# Altium schematic sheet TX_Node.SchDoc
size A; SheetNumber: 1; SheetTotal: 1
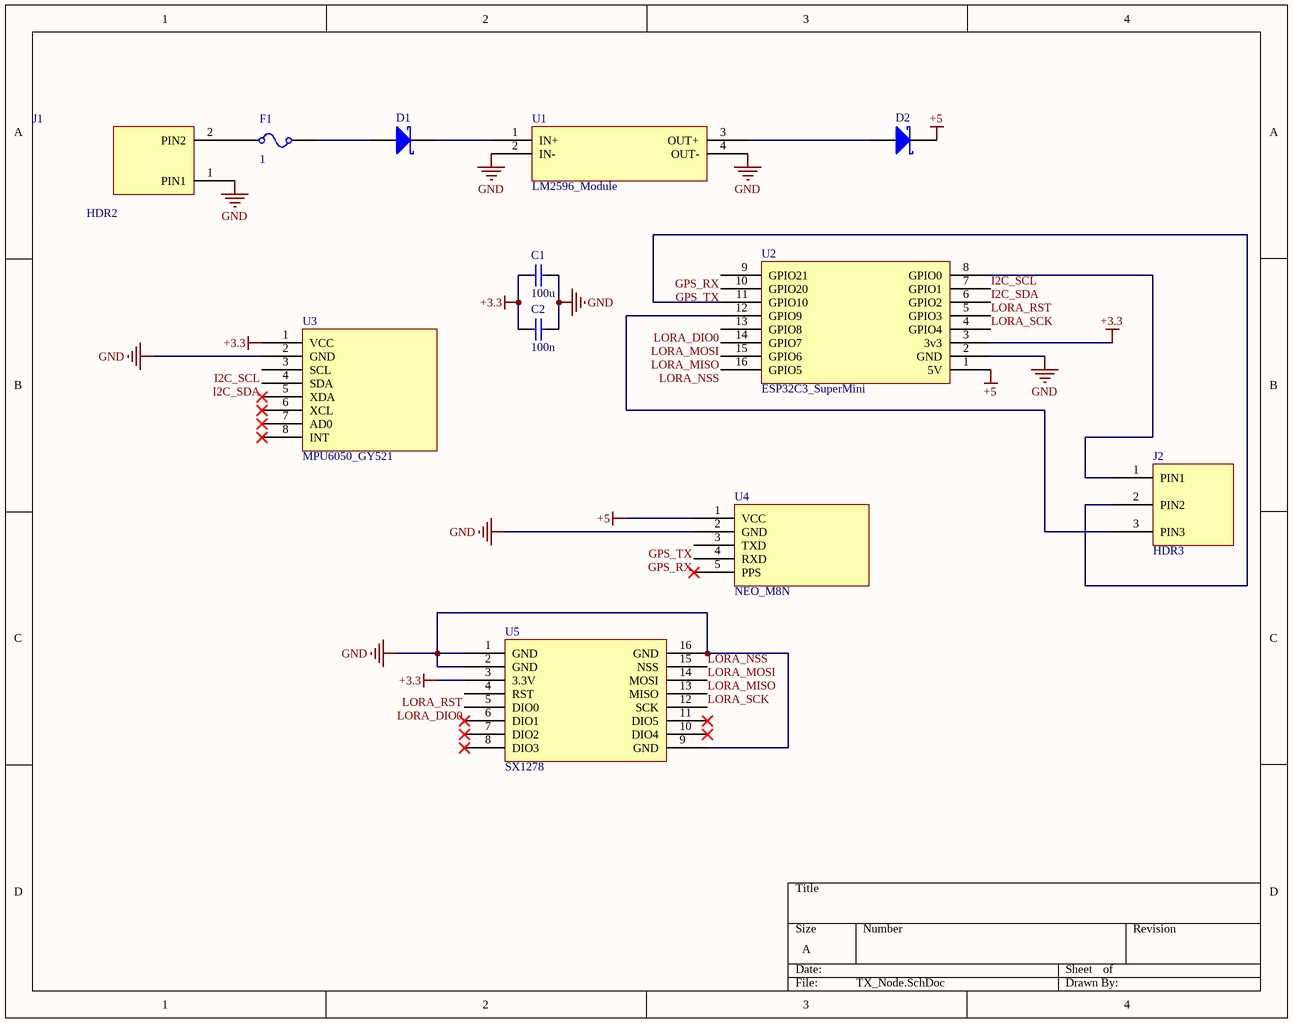
[diagram p0: TX_Node.SchDoc]

## Parts
C1  value 100u  [HDR_1X2]  (hidden comment: Capacitor)
C2  value 100n  [HDR_1X2]  (hidden comment: Capacitor)
D1  Schottky Diode  [TH_10MM]  (value not drawn)
D2  Schottky Diode  [TH_10MM]  (value not drawn)
F1  CURRENT: 1  [TH_5MM]  (hidden comment: Fuse)
J1  HDR2  [HDR_1X2]
J2  HDR3  [HDR_1X3]
U1  LM2596_Module  [LM2596_MODULE]
U2  ESP32C3_SuperMini  [ESP32C3_SUPERMINI]
U3  MPU6050_GY521  [GY521_1X8]
U4  NEO_M8N  [NEO_M8N_1X5]
U5  SX1278  [SX1278_BREAKOUT]

## Nets
+3.3: C1.1 C2.1 U2.3(3v3) U3.1(VCC) U5.3(3.3V)
+5: D2.2(K) U2.1(5V) U4.1(VCC)
GND: C1.2 C2.2 J1.1(PIN1) U1.2(IN-) U1.4(OUT-) U2.2(GND) U3.2(GND) U4.2(GND) U5.1(GND) U5.2(GND) U5.9(GND) U5.16(GND)
GPS_RX: U2.9(GPIO21) U4.4(RXD)
GPS_TX: U2.10(GPIO20) U4.3(TXD)
I2C_SCL: U2.7(GPIO1) U3.3(SCL)
I2C_SDA: U2.6(GPIO2) U3.4(SDA)
LORA_DIO0: U2.13(GPIO8) U5.5(DIO0)
LORA_MISO: U2.15(GPIO6) U5.13(MISO)
LORA_MOSI: U2.14(GPIO7) U5.14(MOSI)
LORA_NSS: U2.16(GPIO5) U5.15(NSS)
LORA_RST: U2.5(GPIO3) U5.4(RST)
LORA_SCK: U2.4(GPIO4) U5.12(SCK)
NetD1_1: D1.1(A) F1.2
NetD1_2: D1.2(K) U1.1(IN+)
NetD2_1: D2.1(A) U1.3(OUT+)
NetF1_1: F1.1 J1.2(PIN2)
NetJ2_1: J2.1(PIN1) U2.8(GPIO0)
NetJ2_2: J2.2(PIN2) U2.11(GPIO10)
NetJ2_3: J2.3(PIN3) U2.12(GPIO9)

Not connected (* = marked no-connect by the designer): U3 5(XDA)* 6(XCL)* 7(AD0)* 8(INT)*; U4 5(PPS)*; U5 6(DIO1)* 7(DIO2)* 8(DIO3)* 10(DIO4)* 11(DIO5)*

## Library data of the parts
C1 C2 = Capacitor: SimulationGenericComponent: True
D1 D2 = Schottky Diode: AF: 1; BV: 0; BV_MAX: 1e99; EG: 1.11; FC: 0.5; IBV: 0.001; IS: 1e-14; MJSW: 0.33; NTUN: 30; TNOM: 27; XTI: 3; SimulationGenericComponent: True; CJO: 0; CJP: 0; CTA: 0; CTP: 0; FCS: 0.5; FV_MAX: 1e99; IKF: 0; IKR: 0; ISR: 1e-14; JSW: 0; JTUN: 0; JTUNSW: 0; KEG: 1; KF: 0; LEVEL: 1; N: 1; NBV: 1; NR: 1; NS: 1; PHP: 1; RS: 0; TCV: 0; TLEV: 0; TLEVC: 0; TM1: 0; TM2: 0; TPB: 0; TPHP: 0; TRS: 0; TRS2: 0; TT: 0; TTT1: 0; TTT2: 0; VJ: 1; XTITUN: 3
F1 = Fuse: RESISTANCE: 1m; SimulationGenericComponent: True